# Altium schematic sheet Connect.SchDoc
size A4
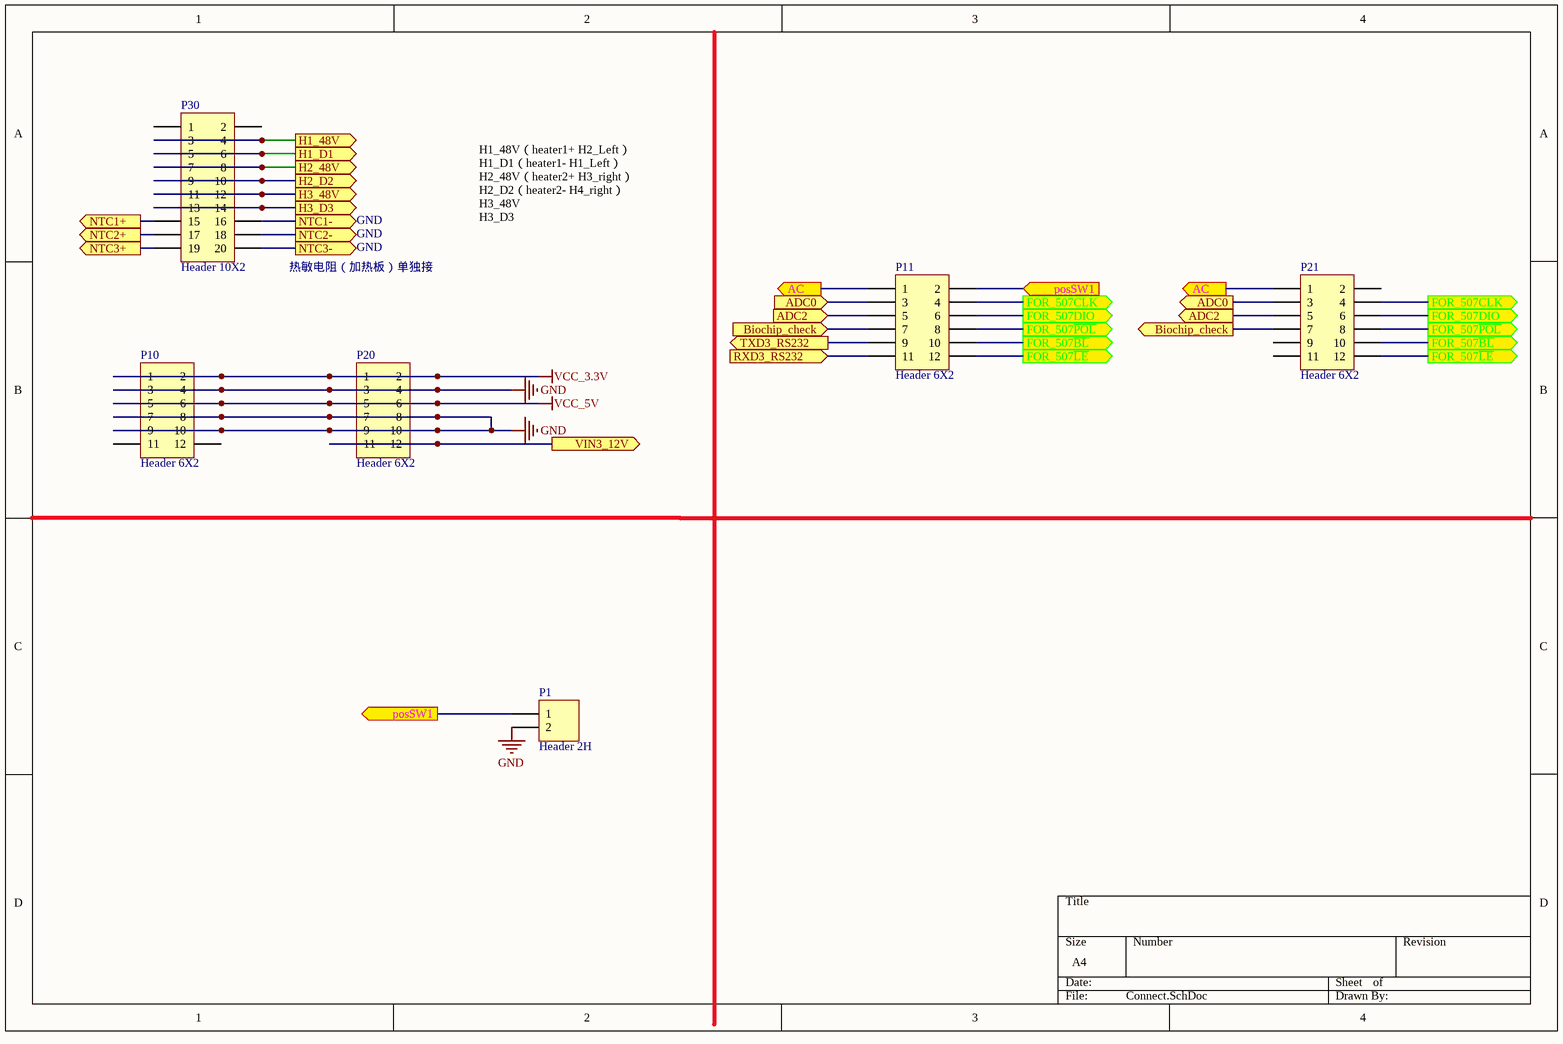
[diagram p0: Connect.SchDoc]

## Parts
P1  Header 2H  [CONN-TH_2P-P2.54_ZX-XH2.54-2PZZ-Y]
P10  Header 6X2  [HDR-6X2]
P11  Header 6X2  [HDR-6X2]
P20  Header 6X2  [HDR-6X2]
P21  Header 6X2  [HDR-6X2]
P30  Header 10X2  [HDR-10X2]

## Ports
AC (out), ADC0 (in), ADC0 (out), ADC2 (in), ADC2 (out), Biochip_check (in), Biochip_check (out), FOR_507CLK (out), FOR_507DIO (out), FOR_507~{BL} (out), FOR_507~{LE} (out), FOR_507~{POL} (out), H1_48V (out), H1_D1 (out), H2_48V (out), H2_D2 (out), H3_48V (out), H3_D3 (out), NTC1+ (out), NTC1- (out), NTC2+ (out), NTC2- (out), NTC3+ (out), NTC3- (out), posSW1 (in), posSW1 (out), RXD3_RS232 (in), TXD3_RS232 (out), VIN3_12V (out)

## Nets
GND: P1.2 P10.3 P10.4 P10.7 P10.8 P10.9 P10.10 P20.3 P20.4 P20.7 P20.8 P20.9 P20.10
VCC_3.3V: P10.1 P10.2 P20.1 P20.2
VCC_5V: P10.5 P10.6 P20.5 P20.6
AC: P11.1 P21.1 ; port AC
ADC0: P11.3 P21.3 ; port ADC0
ADC2: P11.5 P21.5 ; port ADC2
Biochip_check: P11.7 P21.7 ; port Biochip_check
FOR_507~{BL}: P11.10 P21.10 ; port FOR_507~{BL}
FOR_507CLK: P11.4 P21.4 ; port FOR_507CLK
FOR_507DIO: P11.6 P21.6 ; port FOR_507DIO
FOR_507~{LE}: P11.12 P21.12 ; port FOR_507~{LE}
FOR_507~{POL}: P11.8 P21.8 ; port FOR_507~{POL}
H1_48V: P30.3 P30.4 ; port H1_48V
H1_D1: P30.5 P30.6 ; port H1_D1
H2_48V: P30.7 P30.8 ; port H2_48V
H2_D2: P30.9 P30.10 ; port H2_D2
H3_48V: P30.11 P30.12 ; port H3_48V
H3_D3: P30.13 P30.14 ; port H3_D3
NTC1+: P30.15 ; port NTC1+
NTC1-: P30.16 ; port NTC1-
NTC2+: P30.17 ; port NTC2+
NTC2-: P30.18 ; port NTC2-
NTC3+: P30.19 ; port NTC3+
NTC3-: P30.20 ; port NTC3-
posSW1: P1.1 P11.2 ; port posSW1
RXD3_RS232: P11.11 ; port RXD3_RS232
TXD3_RS232: P11.9 ; port TXD3_RS232
VIN3_12V: P20.11 P20.12 ; port VIN3_12V

Not connected (* = marked no-connect by the designer): P10 11 12; P21 2 9 11; P30 1 2

## Notes on the sheet
- GND
- H1_48V（heater1+ H2_Left）
  H1_D1（heater1- H1_Left）
  H2_48V（heater2+ H3_right）
  H2_D2（heater2- H4_right）
  H3_48V
  H3_D3
- 热敏电阻（加热板）单独接

## Library data of the parts
P1 = Header 2H: Header, 2-Pin, Right Angle; LatestRevisionDate: 17-Jul-2002; LatestRevisionNote: Re-released for DXP Platform.; Publisher: Altium Limited
P10 P11 P20 P21 = Header 6X2: Header, 6-Pin, Dual row; LatestRevisionDate: 17-Jul-2002; LatestRevisionNote: Re-released for DXP Platform.; Publisher: Altium Limited
P30 = Header 10X2: Header, 10-Pin, Dual row; LatestRevisionDate: 17-Jul-2002; LatestRevisionNote: Re-released for DXP Platform.; Publisher: Altium Limited